# EasyEDA Pro project stm32rct6开发板.epro, board PCB1
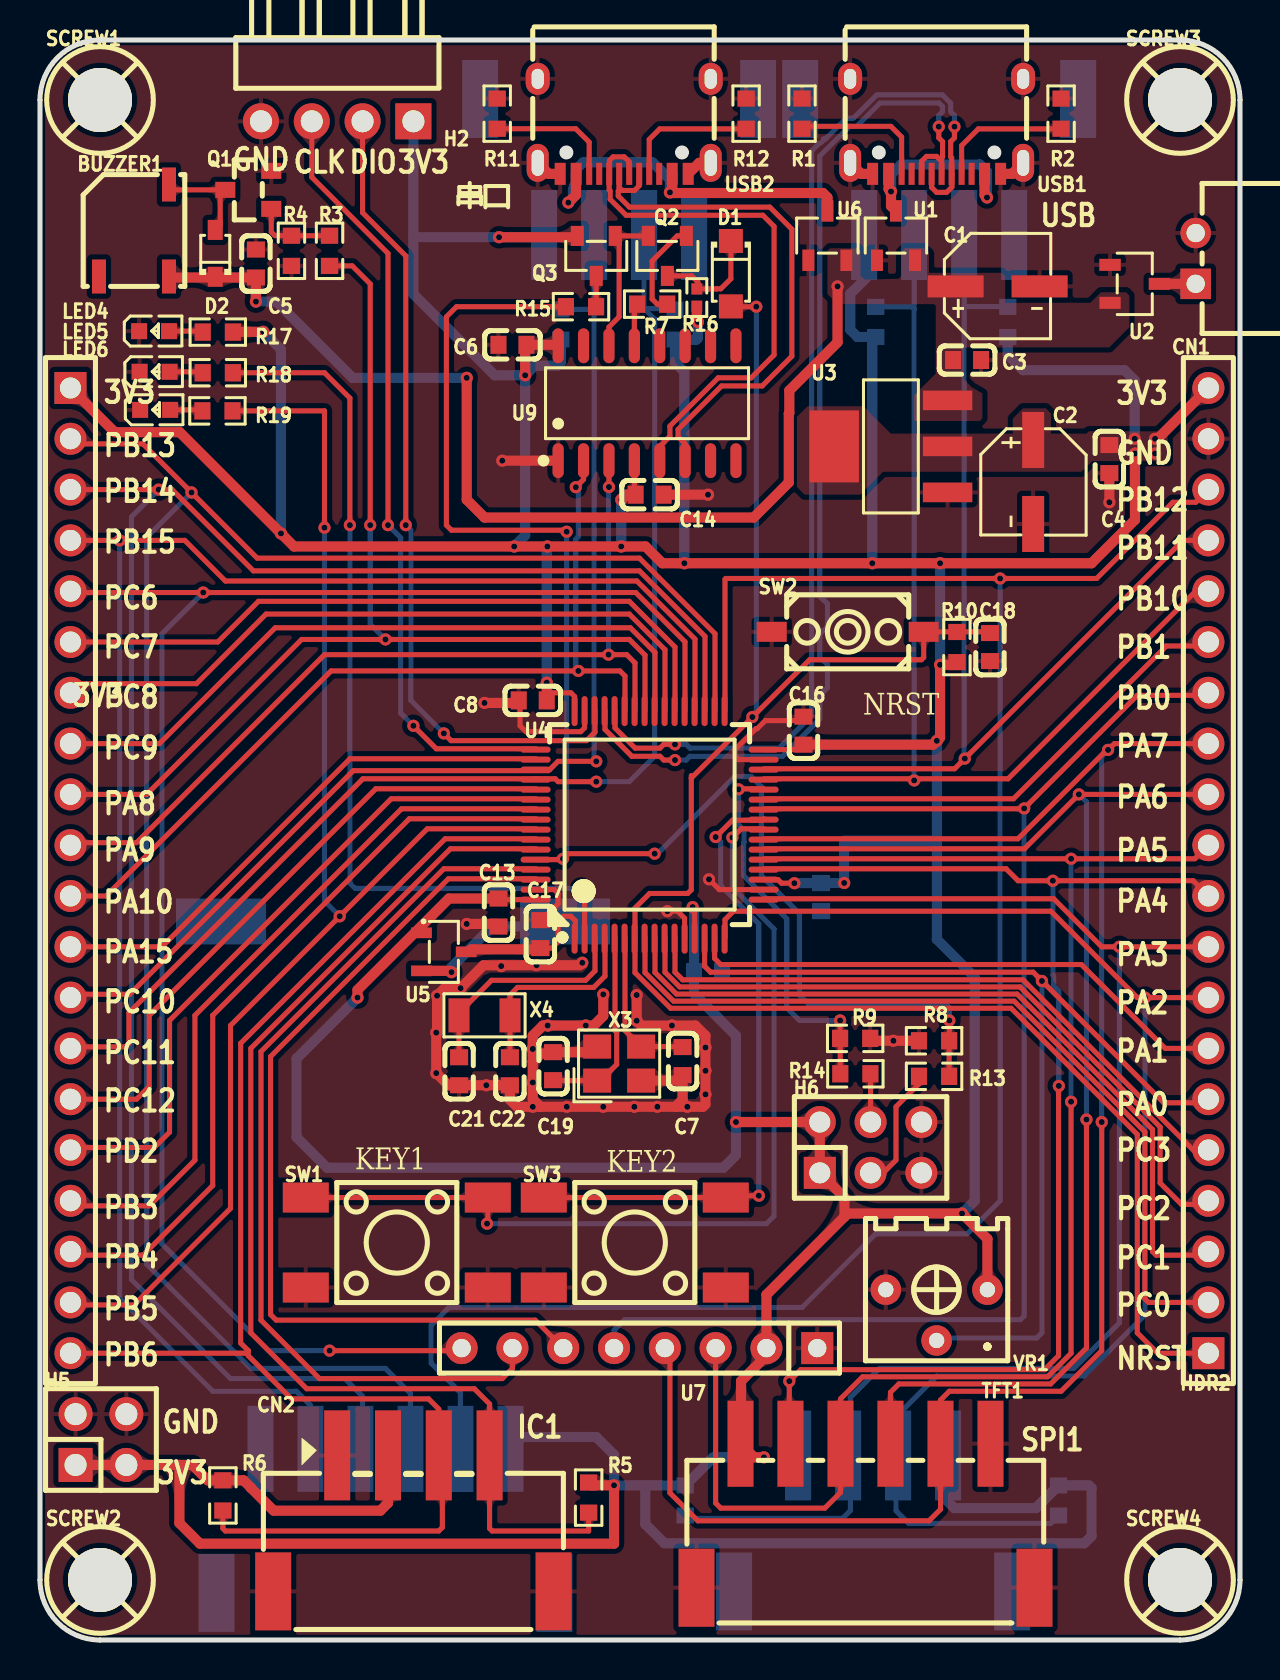
[diagram p3: board, top side]
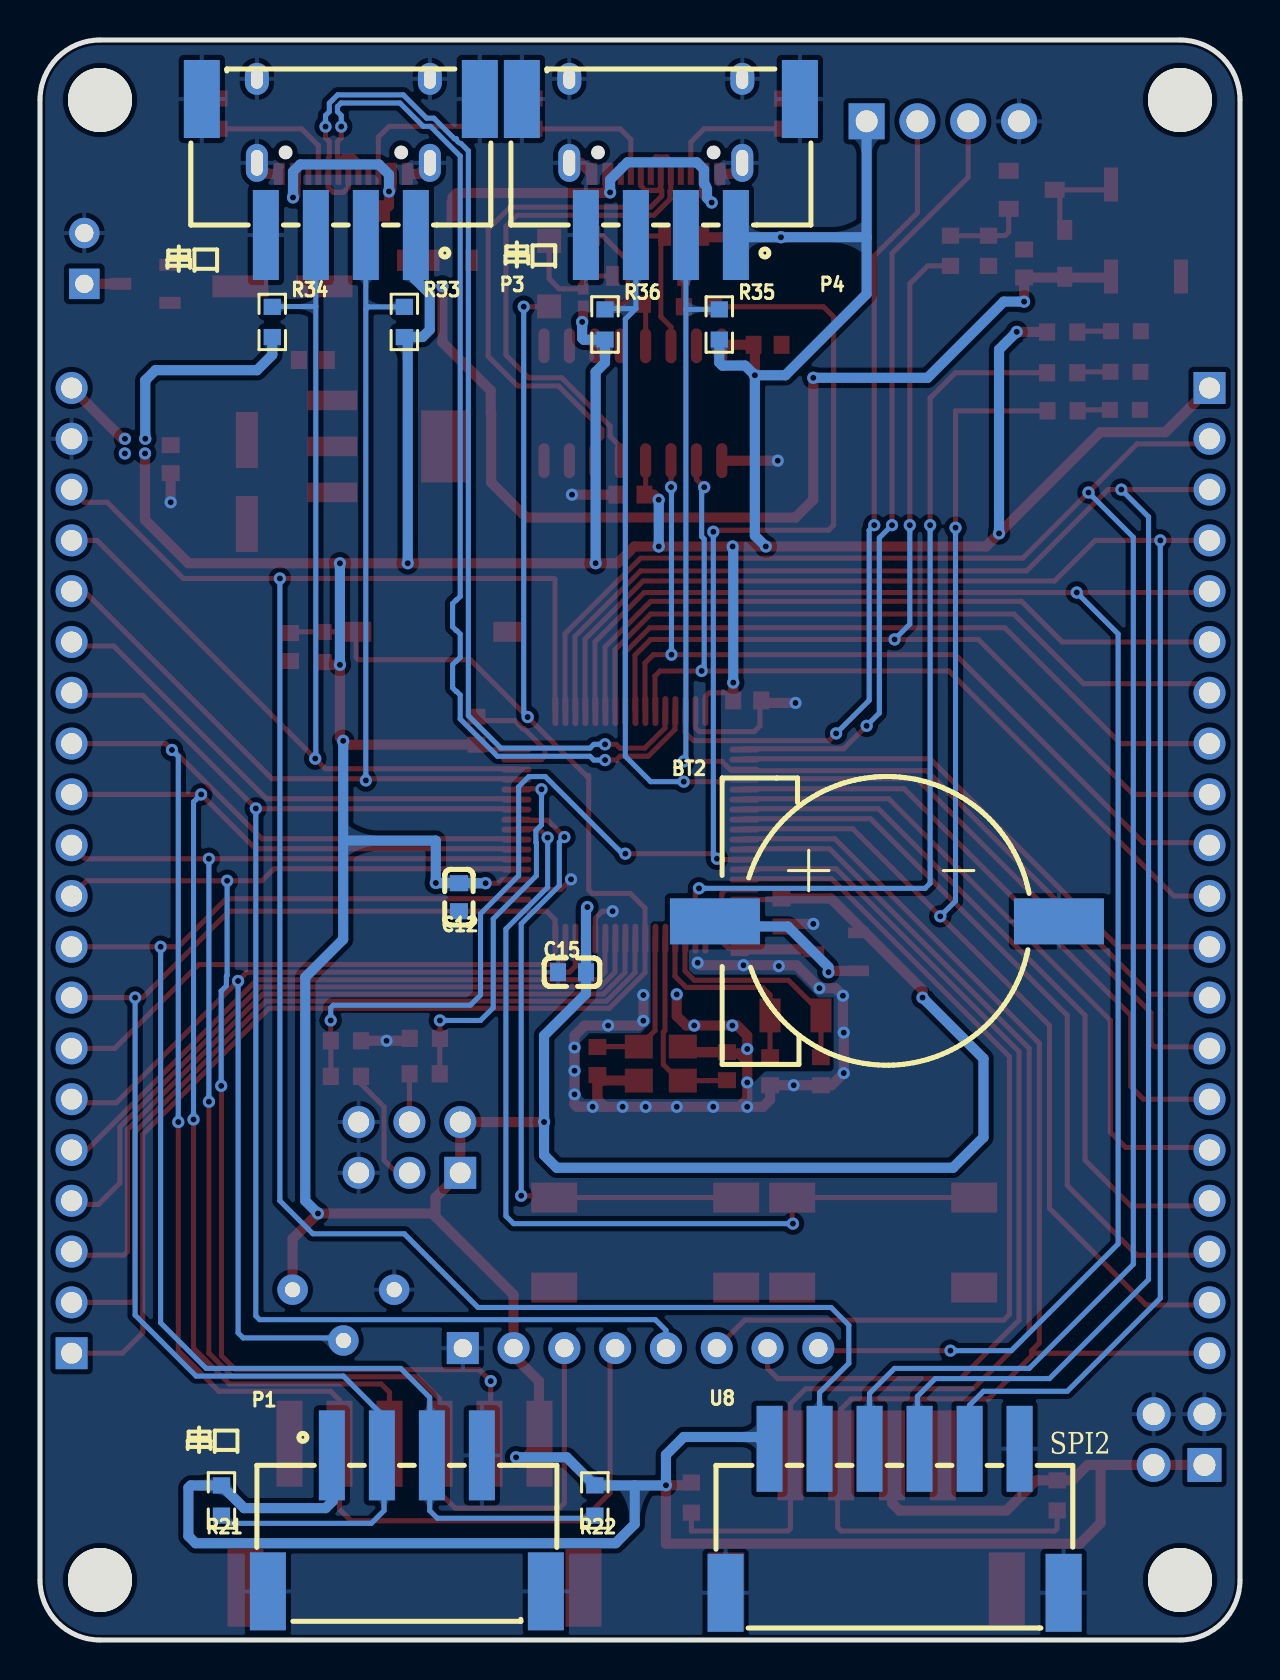
[diagram p4: board, bottom side, seen from below]

Outline 60 x 80 mm; copper layers: Top Layer, Bottom Layer. Coordinates in mm from the lower left corner of the outline.
Outline path: 0,77 0,3 arc(0.88,0.88) 3,0 57,0 arc(59.12,0.88) 60,3 60,77 arc(59.12,79.12) 57,80 3,80 arc(0.88,79.12) 0,77
Stack: Top Layer 0.035mm / Dielectric1 1.51mm FR4 er 4.5 / Bottom Layer 0.035mm

## Design rules (mm)
net +5V: POWER
net +3V3: POWER
net PA11: DP2
net PA12: DP2
net USB_D+: DP1
net USB_D-: DP1
spacing copperThickness1oz (default): track to track 0.102, other pairs 0.152 to 0.3
spacing copperThickness2oz: track to track 0.203, other pairs 0.152 to 0.3
track width copperThickness1oz (default): min 0.127, default 0.508, max 2.54
track width copperThickness2oz: min 0.203, default 0.508, max 2.54
differential pair differentialPair (default): width min 0.127, default 0.254, max 2.54; gap min 0.152, default 0.152
net +3V3 uses copperRegion_copperThickness2oz, copperThickness2oz
net class POWER uses copperThickness2oz
net +5V uses copperRegion_copperThickness2oz, copperThickness2oz
net GND uses copperRegion_copperThickness1oz

## Placement (name value [footprint] x y rotation side)
BT2  CR1220-2ZX  [BAT-SMD_CR1220-2ZX]  17.65 35.93 180 bottom
BUZZER1  4kHz  [BUZ-SMD_L5.0-W5.5-P4.60]  4.7 70.47 90 top
C1  10uF  [CAP-SMD_BD5.0-L5.3-W5.3-LS6.0-FD]  47.88 67.68 0 top
C2  10uF  [CAP-SMD_BD5.0-L5.3-W5.3-LS6.0-FD]  49.66 57.9 270 top
C3  100nF  [C0603]  46.35 64 180 top
C4  100nF  [C0603]  53.47 59.05 90 top
C5  100nF  [C0603]  10.79 68.82 90 top
C6  100nF  [C0603]  23.62 64.76 0 top
C7  18pF  [C0603]  32.13 28.95 90 top
C8  100nF  [C0603]  24.64 46.98 0 top
C12  100nF  [C0603]  39.05 37.14 90 bottom
C13  100nF  [C0603]  22.93 36.37 90 top
C14  100nF  [C0603]  30.48 57.27 180 top
C15  100nF  [C0603]  33.4 33.39 180 bottom
C16  100nF  [C0603]  38.18 45.47 270 top
C17  100nF  [C0603]  25.02 35.3 90 top
C18  100nF  [C0603]  47.5 49.65 90 top
C19  18pF  [C0603]  25.65 28.69 90 top
C21  18pF  [C0603]  20.96 28.44 270 top
C22  18pF  [C0603]  23.5 28.44 90 top
CN1  WAFER-XH254WZ-2AM  [CONN-TH_2P-P2.50_WAFER-XH254WZ-2A]  57.78 69.08 90 top
CN2  XDWF-2500-04P  [CONN-SMD_4P-P2.54_MXXH-2.54-04P-WT1-0-A]  18.67 5.83 0 top
D1  1N4007W  [SOD-123FL_L2.7-W1.8-LS3.8-RD]  34.54 68.32 270 top
D2  1N5819WS  [SOD-323_L1.8-W1.3-LS2.5-RD]  8.76 69.33 90 top
H2  PZ254R-11-04P  [HDR-TH_4P-P2.54-H-M-W10.4]  14.86 75.94 180 top
H5  PZ254V-12-4P  [HDR-TH_4P-P2.54-V-M-R2-C2-S2.54]  3.05 10.02 0 top
H6  -  [HDR-TH_6P-P2.54-V-R2-C3-S2.54_A2541WV-2X3P]  41.53 24.63 0 top
HDR1  PH2.54-01-20PZD  [HDR-TH_20P-P2.54-V-M-4]  1.52 38.47 270 top
HDR2  PH2.54-01-20PZD  [HDR-TH_20P-P2.54-V-M-4]  58.42 38.47 90 top
LED4  LTST-C190KSKT  [LED0603-RD]  5.7 65.44 0 top
LED5  LTST-C190KSKT  [LED0603-RD]  5.73 63.41 0 top
LED6  LTST-C190KSKT  [LED0603-RD]  5.76 61.51 0 top
P1  -  [CONN-SMD_XH2.54-4PSMD]  41.66 5.83 180 bottom
P3  -  [CONN-SMD_XH2.54-4PSMD]  44.96 73.65 0 bottom
P4  -  [CONN-SMD_XH2.54-4PSMD]  28.96 73.65 0 bottom
Q1  SS8050  [SOT-23_L2.9-W1.3-P1.90-LS2.4-BR]  10.41 72.51 0 top
Q2  S8050(0.5A)  [SOT-23-3_L2.9-W1.3-P1.90-LS2.4-BR]  31.37 69.2 90 top
Q3  S8550  [SOT-23-3_L2.9-W1.3-P1.90-LS2.4-BR]  27.81 69.2 90 top
R1  5.1kΩ  [R0603]  38.1 76.32 90 top
R2  5.1kΩ  [R0603]  51.05 76.32 90 top
R3  560Ω  [R0603]  14.48 69.46 90 top
R4  10kΩ  [R0603]  12.57 69.46 270 top
R5  4.7kΩ  [R0603]  27.43 7.12 270 top
R6  4.7kΩ  [R0603]  9.14 7.23 270 top
R7  1kΩ  [R0603]  30.61 66.79 0 top
R8  100kΩ  [R0603]  44.7 29.96 180 top
R9  10kΩ  [R0603]  40.76 30.08 180 top
R10  10kΩ  [R0603]  45.85 49.65 270 top
R11  5.1kΩ  [R0603]  22.86 76.32 90 top
R12  5.1kΩ  [R0603]  35.31 76.32 90 top
R13  10kΩ  [R0603]  44.7 28.18 180 top
R14  10kΩ  [R0603]  40.77 28.31 180 top
R15  1kΩ  [R0603]  27.05 66.67 0 top
R16  10kΩ  [R0402]  32.84 67.12 270 top
R17  1kΩ  [R0603]  8.89 65.39 180 top
R18  1kΩ  [R0603]  8.89 63.36 180 top
R19  1kΩ  [R0603]  8.87 61.46 180 top
R21  10K  [R0603]  50.93 6.97 90 bottom
R22  10K  [R0603]  32.26 6.97 90 bottom
R33  10K  [R0603]  41.78 65.9 270 bottom
R34  10K  [R0603]  48.39 65.9 270 bottom
R35  10K  [R0603]  26.03 65.78 270 bottom
R36  10K  [R0603]  31.75 65.78 270 bottom
SCREW1  -  [M3螺丝]  3 77 0 top
SCREW2  -  [M3螺丝]  3 3 0 top
SCREW3  -  [M3螺丝]  57 77 0 top
SCREW4  -  [M3螺丝]  57 3 0 top
SW1  -  [SW-SMD_4P-L6.0-W6.0-P4.50-LS9.0-2]  17.84 19.87 0 top
SW2  K2-1107ST-A4DW-06  [KEY-SMD_L6.2-W3.6-LS8.0_K2-1107ST-A4SW-06]  40.39 50.41 0 top
SW3  -  [SW-SMD_4P-L6.0-W6.0-P4.50-LS9.0-2]  29.74 19.87 0 top
TFT1  1.8 TFT 128*RGB*160  [LCD-TH_8P-P2.54-L56.0-W34.0_1.8-TFT]  29.97 14.59 180 top
U1  CH213K  [SOT-23-3_L2.9-W1.6-P1.90-LS2.8-BR]  42.8 70.22 270 top
U2  CH213K  [SOT-23-3_L2.9-W1.6-P1.90-LS2.8-BR]  54.74 67.81 180 top
U3  AMS1117-3.3  [SOT-223-4_L6.5-W3.5-P2.30-LS7.0-BR]  42.54 59.68 0 top
U4  STM32F103RCT6  [LQFP-64_L10.0-W10.0-P0.50-LS12.0-BL]  30.48 40.76 0 top
U5  BAT54C  [SOT-23-3_L2.9-W1.3-P1.90-LS2.8-BR]  20.19 34.41 180 top
U6  CH213K  [SOT-23-3_L2.9-W1.6-P1.90-LS2.8-BR]  39.37 70.22 270 top
U7  XH2.54mm-LI-6P  [CONN-SMD_6P-P2.50-H]  41.28 6.21 0 top
U8  XH2.54mm-LI-6P  [CONN-SMD_6P-P2.50-H]  17.27 5.96 180 bottom
U9  CH340C  [SOP-16_L10.0-W3.9-P1.27-LS6.0-BL]  30.35 61.84 0 top
USB1  TYPE-C 16PIN 2MD(073)  [USB-C-SMD_TYPE-C-16PIN-2MD-073]  44.83 75.68 180 top
USB2  TYPE-C 16PIN 2MD(073)  [USB-C-SMD_TYPE-C-16PIN-2MD-073]  29.21 75.68 180 top
VR1  10kΩ  [RES-ADJ-TH_3362P]  44.83 16.25 180 top
X3  8MHz  [CRYSTAL-SMD_4P-L3.2-W2.5-BL]  28.96 28.82 0 top
X4  32.768kHz  [CRYSTAL-SMD_L3.2-W1.5-1]  22.22 31.23 0 top

## Footprints (pads in the part's own frame, mm; a bottom-side part is the same pattern mirrored in y, then rotated)
BAT-SMD_CR1220-2ZX
  rect 4.5x2.3 smd: 1(-8.6,0) 2(8.6,0)
BUZ-SMD_L5.0-W5.5-P4.60
  rect 1.7x0.7 smd: 1(-2.3,-1.75) 2(2.3,-1.75) 3(-2.3,1.75)
C0603
  rect 0.8x0.9 smd: 1(-0.7,0) 2(0.7,0)
CAP-SMD_BD5.0-L5.3-W5.3-LS6.0-FD
  rect 2.8x1.1 smd: 1(-2.1,0) 2(2.1,0)
CONN-SMD_4P-P2.54_MXXH-2.54-04P-WT1-0-A
  rect 1.3x4.5 smd: 1(-3.809,3.4) 2(-1.27,3.4) 3(1.27,3.4) 4(3.81,3.4)
  rect 1.8x3.9 smd: 5(7.01,-3.4) 6(-7.01,-3.4)
CONN-SMD_6P-P2.50-H
  rect 1.3x4.3 smd: 1(-6.25,3.6) 2(-3.751,3.6) 3(-1.25,3.6) 4(1.25,3.6) 5(3.75,3.6) 6(6.25,3.6)
  rect 1.8x3.9 smd: 7(-8.45,-3.6) 8(8.45,-3.6)
CONN-SMD_XH2.54-4PSMD
  rect 1.3x4.5 smd: 1(-3.75,3.4) 2(-1.25,3.4) 3(1.25,3.4) 4(3.75,3.4)
  rect 1.8x3.9 smd: 5(-6.95,-3.4) 6(6.95,-3.4)
CONN-TH_2P-P2.50_WAFER-XH254WZ-2A
  rect 1.524x1.524 hole 0.914: 1(-1.27,0)
  round 1.524 hole 0.914: 2(1.27,0)
CRYSTAL-SMD_4P-L3.2-W2.5-BL
  rect 1.4x1.2 smd: 1(-1.1,-0.85) 2(1.1,-0.85) 3(1.1,0.85) 4(-1.1,0.85)
CRYSTAL-SMD_L3.2-W1.5-1
  rect 1.05x1.7 smd: 1(-1.275,0) 2(1.275,0)
HDR-TH_4P-P2.54-H-M-W10.4
  rect 1.8x1.8 hole 1.1: 1(-3.81,0)
  round 1.8 hole 1.1: 2(-1.27,0) 3(1.27,0) 4(3.81,0)
HDR-TH_4P-P2.54-V-M-R2-C2-S2.54
  rect 1.7x1.7 hole 1.1: 1(-1.27,-1.27)
  round 1.7 hole 1.1: 2(-1.27,1.27) 3(1.27,-1.27) 4(1.27,1.27)
HDR-TH_6P-P2.54-V-R2-C3-S2.54_A2541WV-2X3P
  rect 1.6x1.6 hole 1.05: 1(-2.54,-1.27)
  round 1.6 hole 1.05: 2(-2.54,1.27) 3(0,-1.27) 4(0,1.27) 5(2.54,-1.27) 6(2.54,1.27)
HDR-TH_20P-P2.54-V-M-4
  rect 1.6x1.6 hole 1.05: 1(-24.13,0)
  round 1.6 hole 1.05: 2(-21.59,0) 3(-19.05,0) 4(-16.51,0) 5(-13.97,0) 6(-11.43,0) 7(-8.89,0) 8(-6.35,0) 9(-3.81,0) 10(-1.27,0) 11(1.27,0) 12(3.81,0) 13(6.35,0) 14(8.89,0) 15(11.43,0) 16(13.97,0) 17(16.51,0) 18(19.05,0) 19(21.59,0) 20(24.13,0)
KEY-SMD_L6.2-W3.6-LS8.0_K2-1107ST-A4SW-06
  rect 1.5x1 smd: 1(-3.8,0) 2(3.8,0)
LCD-TH_8P-P2.54-L56.0-W34.0_1.8-TFT
  rect 1.6x1.6 hole 0.914: 1(-8.89,0)
  round 1.6 hole 0.914: 2(-6.35,0) 3(-3.81,0) 4(-1.27,0) 5(1.27,0) 6(3.81,0) 7(6.35,0) 8(8.89,0)
LED0603-RD
  rect 0.8x0.8 smd: 1(-0.749,0) 2(0.749,0)
LQFP-64_L10.0-W10.0-P0.50-LS12.0-BL
  oval 0.3x1.5 smd: 1(-3.75,-5.688) 2(-3.25,-5.688) 3(-2.75,-5.688) 4(-2.25,-5.688) 5(-1.75,-5.688) 6(-1.25,-5.688) 7(-0.75,-5.688) 8(-0.25,-5.688) 9(0.25,-5.688) 10(0.75,-5.688) 11(1.25,-5.688) 12(1.75,-5.688) 13(2.25,-5.688) 14(2.75,-5.688) 15(3.25,-5.688) 16(3.75,-5.688) 33(3.75,5.688) 34(3.25,5.688) 35(2.75,5.688) 36(2.25,5.688) 37(1.75,5.688) 38(1.25,5.688) 39(0.75,5.688) 40(0.25,5.688) 41(-0.25,5.688) 42(-0.75,5.688) 43(-1.25,5.688) 44(-1.75,5.688) 45(-2.25,5.688) 46(-2.75,5.688) 47(-3.25,5.688) 48(-3.75,5.688)
  oval 1.5x0.3 smd: 17(5.7,-3.738) 18(5.7,-3.238) 19(5.7,-2.738) 20(5.7,-2.238) 21(5.7,-1.738) 22(5.7,-1.238) 23(5.7,-0.739) 24(5.7,-0.238) 25(5.7,0.262) 26(5.7,0.762) 27(5.7,1.262) 28(5.7,1.762) 29(5.7,2.261) 30(5.7,2.762) 31(5.7,3.261) 32(5.7,3.762) 49(-5.7,3.762) 50(-5.7,3.261) 51(-5.7,2.762) 52(-5.7,2.261) 53(-5.7,1.762) 54(-5.7,1.262) 55(-5.7,0.762) 56(-5.7,0.262) 57(-5.7,-0.238) 58(-5.7,-0.739) 59(-5.7,-1.238) 60(-5.7,-1.738) 61(-5.7,-2.238) 62(-5.7,-2.738) 63(-5.7,-3.238) 64(-5.7,-3.738)
M3螺丝
  round 3.2 hole 3.2: 1(0,0)
R0402
  rect 0.566x0.54 smd: 1(-0.433,0) 2(0.433,0)
R0603
  rect 0.806x0.864 smd: 1(-0.753,0) 2(0.753,0)
RES-ADJ-TH_3362P
  round 1.524 hole 0.762: 1(-2.54,-1.27) 2(0,1.27) 3(2.54,-1.27)
SOD-123FL_L2.7-W1.8-LS3.8-RD
  rect 1.2x1.2 smd: 1(-1.635,0) 2(1.635,0)
SOD-323_L1.8-W1.3-LS2.5-RD
  rect 1x0.75 smd: 1(-1.173,0) 2(1.173,0)
SOP-16_L10.0-W3.9-P1.27-LS6.0-BL
  oval 0.56x1.745 smd: 1(-4.445,-2.873) 2(-3.175,-2.873) 3(-1.905,-2.873) 4(-0.635,-2.873) 5(0.635,-2.873) 6(1.905,-2.873) 7(3.175,-2.873) 8(4.445,-2.873) 9(4.445,2.873) 10(3.175,2.873) 11(1.905,2.873) 12(0.635,2.873) 13(-0.635,2.873) 14(-1.905,2.873) 15(-3.175,2.873) 16(-4.445,2.873)
SOT-23-3_L2.9-W1.3-P1.90-LS2.4-BR
  rect 1x0.65 smd: 1(1,-0.95) 2(1,0.95) 3(-1,0)
SOT-23-3_L2.9-W1.3-P1.90-LS2.8-BR
  rect 1.04x0.532 smd: 1(1.12,-0.95) 2(1.12,0.95) 3(-1.12,0)
SOT-23-3_L2.9-W1.6-P1.90-LS2.8-BR
  rect 1.07x0.6 smd: 1(1.235,-0.95) 2(1.235,0.95) 3(-1.235,0)
SOT-23_L2.9-W1.3-P1.90-LS2.4-BR
  rect 1x0.8 smd: 1(1.15,-0.95) 2(1.15,0.95) 3(-1.15,0)
SOT-223-4_L6.5-W3.5-P2.30-LS7.0-BR
  rect 2.47x0.98 smd: 1(2.835,-2.3) 2(2.835,0) 3(2.835,2.3)
  rect 2.47x3.6 smd: 4(-2.835,0)
SW-SMD_4P-L6.0-W6.0-P4.50-LS9.0-2
  rect 2.3x1.5 smd: 1(-4.55,2.25) 2(4.55,2.25) 3(-4.55,-2.25) 4(4.55,-2.25)
USB-C-SMD_TYPE-C-16PIN-2MD-073
  oval 1.1x1.9 hole 0.6x1.3: 13(-4.325,1.825) 14(4.325,1.825)
  oval 1.2x1.6 hole 0.6x1: 13(-4.325,-2.375) 14(4.325,-2.375)
  rect 0.55x1.1 smd: A1B12(-3.2,2.375) A4B9(-2.4,2.375) B1A12(3.2,2.375) B4A9(2.4,2.375)
  rect 0.3x1.1 smd: A5(-1.25,2.375) A6(-0.25,2.375) A7(0.25,2.375) A8(1.25,2.375) B5(1.75,2.375) B6(0.75,2.375) B7(-0.75,2.375) B8(-1.75,2.375)

## Nets
As in the schematic.

Pads without a net: BUZZER1 3; SCREW1 1; SCREW2 1; SCREW3 1; SCREW4 1; U9 7 8 9 10 11 12 15; USB1 A8 B8; USB2 A8 B8

## Via types
v1: diameter 0.61, hole 0.305, Top Layer to Bottom Layer, 121 vias

## Routing (per net, layer and track width the routed paths; a pad name or vN(x,y) marks a point on that pad's centre or on a via; arc(x,y) is an arc through that point)
+3V3: length 423.3
  Top Layer w0.254: C13.2 22.98,37.02 U4.64 ; C16.2 37.93,44.52 U4.32 ; v1(37.72,37.84) 37.08,37.84 36.9,38.02 U4.19 ; 25.34,47.11 25.59,47.36 26.54,47.36 26.73,47.17 26.73,46.44 ; v1(32.63,36.65) 32.73,36.55 U4.13 ; U9.4 29.72,57.27
  Top Layer w0.508: v1(15.88,32.12) 15.88,32.5 20.45,37.07 C13.2 ; C8.2 v1(25.34,47.87) ; R17.1 9.66,65.41 v1(11.16,65.41) ; 47.37,17.52 47.37,20.06 v1(46.1,21.33) 40.39,21.33 40.22,21.16 ; C16.2 44.65,44.77 45,45.12 v1(45,48.76) 45.71,48.76 R10.2 ; 6.97,8.75 7.62,8.75 8.39,7.98 R6.1 10.18,7.98 10.54,7.62 10.54,7.61 11.68,6.47 17.02,6.47 17.4,6.85 CN2.2 ; 6.97,8.75 H5.3 H5.1 ; 6.97,8.75 6.97,5.85 8,4.82 28.7,4.82 v1(28.7,7.74) 27.57,7.74 R5.1 ; v1(29.07,57.01) 29.32,57.27 C14.2 ; v1(34.8,25.9) H6.2 H6.1 40.22,22.12 40.22,21.16 ; v1(22.95,70.14) 26.8,70.14 Q3.2 ; v1(32.89,65.9) 32.84,65.95 R16.2 ; HDR1.1 3.73,60.39 6.98,60.39 v1(12.05,55.33) 12.7,54.68 v1(23.71,54.68) v1(25.37,54.68) v1(29.06,54.68) 30.28,54.68 31.12,53.84 v1(32.22,53.84) v1(41.61,53.84) v1(45,53.84) 52.58,53.84 54.75,56.01 v1(54.75,59.33) ; v1(55.75,60.06) 55.88,60.06 HDR2.20 ; 40.22,21.16 36.32,17.26 TFT1.2 36.32,14.21 35.05,12.94 35.05,9.84 U7.1 35.7,9.13 v1(36.19,9.13) ; v1(24.26,63.24) 24.26,64.69 C6.2 25.86,64.76 U9.16
  Bottom Layer w0.508: P3.1 41.28,70.18 41.28,68.07 40.51,67.31 40.51,65.51 40.87,65.15 R33.2 41.61,64.98 v1(41.61,53.84) ; v1(54.74,60.06) 54.74,62.98 54.23,63.49 49.15,63.49 48.39,64.25 R34.2 ; 30.26,7.73 R22.2 33.66,9.13 v1(36.19,9.13) ; 30.26,7.73 28.71,7.73 v1(28.7,7.74) 28.7,9.26 27.81,10.15 24.11,10.15 U8.1 ; 30.26,7.73 30.26,5.79 31.22,4.84 52.22,4.84 52.58,5.2 52.58,7.61 52.46,7.73 R21.2 49.79,6.59 45.72,6.59 45.36,6.95 45.36,9.19 P1.1 ; v1(12.05,55.33) 12.05,64.52 v1(11.16,65.41) ; 31.75,64.76 31.75,63.87 32.22,63.4 v1(32.22,53.84) ; 31.75,64.76 32,65.01 32.81,65.01 32.89,65.09 v1(32.89,65.9) ; 31.75,64.76 R36.2 ; v1(44.84,44.96) 44.84,39.97 ; 44.84,39.97 44.84,35.03 46.74,33.14 46.74,21.96 v1(46.1,21.33) ; 44.84,39.97 40.21,39.97 v1(40.21,37.85) 39.07,37.85 C12.2 v1(37.72,37.84) ; v1(24.26,63.24) 24.74,63.72 25.89,63.72 26.03,63.87 R35.2 ; v1(24.26,63.24) 22.73,63.24 18.67,67.3 18.67,70.14 ; v1(24.26,63.24) 24.26,55.22 v1(23.71,54.68) ; v1(29.06,54.68) 29.06,57.01 v1(29.07,57.01) ; P4.1 25.1,70.14 v1(22.95,70.14) 18.67,70.14 ; v1(32.63,36.65) 32.7,36.58 32.7,32.31 34.8,30.22 v1(34.8,25.9) 34.8,24.25 34.16,23.61 14.35,23.61 12.83,25.14 12.83,29.07 v1(15.88,32.12) ; v1(25.34,47.87) 25.34,54.54 25.4,54.6 ; v1(45,53.84) v1(45,48.76) ; 18.67,70.14 H2.1
  vias: v1(55.76,59.33)
+5V: length 51.8
  Top Layer w0.508: v1(39.88,67.68) 39.88,64.89 37.47,62.47 37.47,61.35 37.44,61.32 37.44,57.88 35.69,56.12 22.22,56.12 21.34,57.01 v1(21.34,63.11) ; BUZZER1.1 6.5,68.12 C5.1 v1(10.79,66.92)
  Bottom Layer w0.508: v1(10.79,66.92) 11.81,66.92 15.62,63.11 v1(21.34,63.11)
GND: length 88.3
  Top Layer w0.254: U4.31 34.93,44.02 34.75,44.2 34.75,44.51 35.79,45.56 35.86,45.56 36.26,45.97 37.98,45.97 C16.1 ; v1(31.37,36.44) 31.88,36.44 32.23,36.09 U4.12 ; 27.23,46.44 27.23,45.61 27.04,45.42 24.3,45.42 24,45.71 24,46.92 C8.1 ; C17.2 25.08,36 25.91,36.82 25.91,37.33 25.72,37.52 U4.63 ; U4.18 33.97,37.52 v1(33.45,38.03)
  Top Layer w0.508: USB2.A1B12 32.96,73.86 USB2.13 ; C4.1 v1(53.47,56.89) ; C14.1 v1(33.4,57.27) ; USB1.B1A12 41.06,73.31 USB1.14 ; U9.1 v1(23.11,58.97) ; 24.64,28.92 v1(24.64,27.88) 24.64,27.05 25.03,26.66 ; 24.64,28.92 v1(24.64,29.55) 24.64,30.22 25.15,30.72 v1(27.29,30.72) 27.69,30.72 28.16,31.2 v1(28.16,32.28) ; 24.64,28.92 25.05,29.33 25.59,29.33 C19.2 27.58,29.39 X3.4 ; 30.06,27.97 31.85,27.97 C7.1 32.13,27.02 31.77,26.66 ; C8.1 23.81,46.85 v1(22.22,46.85) ; R9.1 41.63,29.96 v1(42.67,29.96) R8.2 ; 31.77,26.66 v1(30.87,26.66) v1(29.72,26.66) v1(28.16,26.66) v1(26.34,26.66) 25.03,26.66 ; 31.77,26.66 v1(32.37,26.66) 33.15,26.66 33.27,26.79 v1(33.27,27.28) v1(33.27,28.46) v1(33.27,29.62) 33.27,30.22 32.77,30.72 v1(31.59,30.72) 30.07,30.72 v1(29.83,30.96) v1(29.83,32.25) ; USB1.13 48.61,73.31 48.03,73.31 ; C13.1 22.79,35.8 v1(21.34,35.8) ; 25.03,26.66 v1(24.64,26.66) 23.85,26.66 23.5,27.02 C22.1 v1(22.32,27.74) C21.2 20.42,27.74 v1(19.81,28.34) v1(19.81,30.37) 19.85,30.41 v1(19.85,32.21) 20.23,32.59 v1(21.03,32.59) 22.17,33.73 23.02,33.73 v1(23.06,33.69) 23.1,33.74 v1(24.83,33.74) 26.99,33.74 v1(27.12,33.86) ; 24.88,73.86 25.44,73.31 USB2.B1A12
  vias: v1(25.38,30.72)
VBAT: length 7.6
  Top Layer w0.254: U4.1 26.77,35.11 26.77,35.96 26.54,36.19 26.16,36.19 25.91,35.93 25.91,34.92 25.59,34.6 C17.1
  Top Layer w0.508: 24.96,34.53 21.57,34.53 21.44,34.41
VBUS1: length 10.5
  Top Layer w0.508: 42.43,73.31 42.43,72.55 v1(42.55,72.43) 42.55,71.7 U1.3 ; v1(47.35,72.13) 47.23,72.24 USB1.A4B9
  Bottom Layer w0.508: v1(42.55,72.43) 42.55,73.27 43.05,73.78 46.99,73.78 47.35,73.42 v1(47.35,72.13)
VBUS2: length 18.9
  Top Layer w0.508: USB2.B4A9 26.8,73.29 26.8,72.25 v1(26.42,71.87) ; U6.3 39.41,71.46 39.37,71.49 39.37,72.13 39.15,72.35 31.53,72.35 v1(31.5,72.38) 31.61,72.49 USB2.A4B9
  Bottom Layer w0.508: v1(26.42,71.87) 26.65,72.11 26.65,72.5 arc(26.69,72.67) 26.8,72.81 26.8,73.52 27.16,73.88 30.63,73.88 31.5,73.02 v1(31.5,72.38)
VBUS3: length 1.8
  Top Layer w0.508: CN1.1 U2.3
ADC_EXT0: length 41.6
  Top Layer w0.254: HDR2.2 55.42,16.88 55.25,17.06 55.25,25.4 48.71,31.94 31.68,31.94 30.25,33.37 30.25,35.11
ADC_EXT1: length 38.9
  Top Layer w0.254: HDR2.3 58.24,19.24 55.81,19.24 55.63,19.42 55.63,25.53 48.85,32.3 31.83,32.3 30.75,33.38 30.75,35.11
ADC_EXT2: length 35.4
  Top Layer w0.254: 31.25,35.11 31.25,33.39 31.98,32.65 49,32.65 56.01,25.65 56.01,22.85 57.08,21.78 58.24,21.78 HDR2.4
ADC_EXT3: length 32.1
  Top Layer w0.254: HDR2.5 58.37,24.45 57.71,24.45 49.15,33.01 32.13,33.01 31.75,33.39 31.75,35.11
ADC_EXT4: length 27.5
  Top Layer w0.254: U4.15 33.73,34.08 34.04,33.77 52.07,33.77 56.26,29.58 HDR2.7
ADC_POT: length 52.6
  Top Layer w0.254: U4.14 33.23,33.69 33.53,33.39 49.66,33.39 v1(50.1,32.95) 56.19,26.86 58.24,26.86 HDR2.6
  Bottom Layer w0.254: 44.83,14.59 45.34,15.1 49.84,15.1 50.1,15.36 v1(50.1,32.95)
AUX_PA15: length 27.2
  Top Layer w0.254: 24.8,44.06 15.5,44.06 6.1,34.66 HDR1.12
AUX_PB0: length 71.7
  Top Layer w0.254: 36.2,41.56 49.19,41.56 v1(49.21,41.58) 54.86,47.23 58.29,47.23 HDR2.14
  Bottom Layer w0.254: TFT1.5 28.7,15.48 29.24,16.02 49.02,16.02 49.21,16.2 v1(49.21,41.58)
AUX_PB1: length 25.5
  Top Layer w0.254: 36.2,42.06 48.68,42.06 56.31,49.7 58.22,49.7 58.42,49.9
AUX_PB3: length 35.8
  Top Layer w0.254: HDR1.17 1.78,21.71 5.46,21.71 7.75,23.99 7.75,31.23 18.08,41.56 24.8,41.56
AUX_PB4: length 37.4
  Top Layer w0.254: 24.8,41.06 18.47,41.06 8.64,31.23 8.64,22.72 5.15,19.24 1.7,19.24 HDR1.18
BOOT0: length 74.8
  Top Layer w0.254: R15.1 20.83,66.67 20.32,66.16 20.32,55.74 20.57,55.49 26.26,55.49 v1(26.33,55.41) ; U4.60 26.11,39.02 v1(26.15,39.06) 26.4,39.32 v1(30.73,39.32) ; v1(45.47,30.98) 45.47,29.97 R8.1 R13.1
  Bottom Layer w0.254: v1(26.33,55.41) 26.33,39.25 v1(26.15,39.06) ; v1(30.73,39.32) 30.88,39.32 34.73,43.17 35.56,43.17 36.07,42.66 36.07,38.22 37.97,36.31 37.97,32.25 38.48,31.74 45.34,31.74 45.47,31.61 v1(45.47,30.98)
BOOT1: length 18.8
  Top Layer w0.254: v1(40,30.98) R9.2 40.01,30.07 R14.2 ; v1(34.93,42.53) 34.95,42.56 36.2,42.56
  Bottom Layer w0.254: v1(34.93,42.53) 34.93,40.76 35.2,40.48 35.2,39.88 35.18,39.86 35.18,38.22 37.34,36.06 37.34,31.61 37.97,30.98 v1(40,30.98)
BUZZ_PWM: length 55.5
  Top Layer w0.254: 30.25,46.49 30.25,49.24 29.46,50.03 v1(17.27,50.03) 13.08,50.03 5.33,42.28 HDR1.9 ; R3.1 15.61,68.71 16.51,67.81 v1(16.51,55.74)
  Bottom Layer w0.254: v1(17.27,50.03) 16.51,50.79 v1(16.51,55.74)
DTR: length 2.1
  Top Layer w0.254: U9.13 29.72,66.66 R7.1
GPIO_PB8: length 46
  Top Layer w0.254: 24.8,38.56 20.19,38.56 11.05,29.42 11.05,15.99 13.97,13.07 23.11,13.07 23.62,13.58 TFT1.7
GPIO_PB9: length 45.2
  Top Layer w0.254: TFT1.6 24.76,15.99 11.81,15.99 11.53,16.27 11.53,29.17 20.42,38.06 24.8,38.06
I2C1_SCL: length 72.3
  Top Layer w0.254: R6.2 9.14,5.58 9.27,5.45 19.94,5.45 20.12,5.63 20.12,9.05 CN2.3 19.94,11.55 19.43,12.06 12.57,12.06 10.41,14.21 10.41,14.47 ; 10.41,14.47 10.29,14.34 HDR1.20 ; 10.41,14.47 10.03,14.85 10.03,29.83 20.26,40.06 24.8,40.06
I2C1_SDA: length 58.2
  Top Layer w0.254: R5.2 27.43,5.45 22.61,5.45 22.48,5.58 CN2.4 22.48,11.8 21.72,12.56 13.34,12.56 10.54,15.36 10.54,29.58 20.52,39.56 24.8,39.56
KEY1: length 46.5
  Top Layer w0.254: 36.2,40.56 35.06,40.56 v1(34.62,40.12) ; 13.29,22.12 22.39,22.12 22.39,20.86 v1(22.35,20.82)
  Bottom Layer w0.254: v1(34.62,40.12) 34.62,37.63 36.7,35.55 36.7,21.2 36.32,20.82 v1(22.35,20.82)
KEY2: length 32.4
  Top Layer w0.254: 25.19,22.12 34.29,22.12 34.38,22.22 v1(35.94,22.22) ; 36.2,41.06 36.13,40.99 34.63,40.99 v1(33.78,40.15)
  Bottom Layer w0.254: v1(33.78,40.15) 34.03,39.89 34.03,37.72 35.94,35.81 v1(35.94,22.22)
LED2: length 68.7
  Top Layer w0.254: 24.8,40.56 19.36,40.56 v1(14.99,36.19) 9.53,30.72 9.53,21.58 4.7,16.75 1.65,16.75 HDR1.19 ; R19.1 14.22,61.46 v1(14.22,55.62)
  Bottom Layer w0.254: v1(14.22,55.62) 14.22,36.95 v1(14.99,36.19)
NRST: length 95.1
  Top Layer w0.254: C18.2 47.44,50.41 SW2.2 44.19,49.13 44.07,49.01 38.48,49.01 v1(35.62,46.15) 32.56,43.1 ; 32.56,43.22 32.56,43.1 ; 32.56,43.1 32.56,37.51 32.38,37.33 30.48,37.33 29.75,36.6 29.75,33.37 31.53,31.59 48.56,31.59 54.86,25.28 54.86,15.36 55.88,14.34 HDR2.1 ; v1(35.81,66.67) 34.56,66.67 D1.2
  Bottom Layer w0.254: v1(35.81,66.67) 35.81,46.34 v1(35.62,46.15)
OSC32_IN: length 11.5
  Top Layer w0.254: 20.83,29.27 20.95,29.39 20.95,31.36 22.58,32.98 27.28,32.98 27.75,33.45 27.75,35.11
OSC32_OUT: length 10
  Top Layer w0.254: 23.5,29.27 23.5,29.27 23.5,32.25 23.88,32.63 27.69,32.63 28.25,33.19 28.25,35.11
OSC_IN: length 9.9
  Top Layer w0.254: C19.1 25.68,27.97 28.03,27.97 28.84,28.78 28.84,30.38 28.75,30.47 28.75,35.11
OSC_OUT: length 7.9
  Top Layer w0.254: C7.2 32.11,29.67 X3.3 29.25,30.47 29.25,35.11
PA2: length 70.7
  Top Layer w0.254: 34.25,35.11 34.25,36.02 34.67,36.44 50.55,36.44 54.86,32.12 v1(55.25,32.12) 58.42,32.12
  Bottom Layer w0.254: v1(55.25,32.12) 55.25,16.25 52.2,13.2 44.83,13.2 43,11.37 43,9.33 P1.2 42.8,9.12 42.8,6.47 43.43,5.83 50.54,5.83 R21.1
PA3: length 71.2
  Top Layer w0.254: HDR2.9 v1(53.97,34.66) 53.09,34.66 50.69,37.06 36.2,37.06
  Bottom Layer w0.254: R22.1 32.39,6.09 40.13,6.09 40.51,6.47 40.51,9.12 P1.3 40.51,9.34 40.51,12.13 41.96,13.58 51.69,13.58 53.97,15.86 v1(53.97,34.66)
PA4: length 63.8
  Top Layer w0.254: 58.42,37.2 57.66,37.96 v1(50.64,37.96) 48.9,37.96 48.3,38.56 36.2,38.56 ; v1(50.94,27.71) 50.93,27.69 50.93,14.21 50.23,13.52 38.04,13.52 v1(37.47,12.94) 37.47,9.87 U7.2
  Bottom Layer w0.254: v1(50.64,37.96) 50.64,33.23 50.68,33.19 50.68,32.71 50.94,32.45 v1(50.94,27.71)
PA5: length 78.8
  Top Layer w0.254: TFT1.3 33.78,6.85 34.04,6.59 39.24,6.59 40.03,7.38 U7.3 40.03,12.06 41.13,13.16 50.38,13.16 51.56,14.34 v1(51.56,26.91) ; 36.2,39.06 v1(51.56,39.06) 57.74,39.06 HDR2.11
  Bottom Layer w0.254: v1(51.56,39.06) v1(51.56,26.91)
PA6: length 64.5
  Top Layer w0.254: 36.2,39.56 49.22,39.56 v1(51.94,42.28) HDR2.12 ; v1(52.32,26.03) 52.32,14.59 50.53,12.8 42.95,12.8 42.52,12.38 U7.4
  Bottom Layer w0.254: v1(52.32,26.03) 52.32,41.9 v1(51.94,42.28)
PA7: length 90.6
  Top Layer w0.254: 36.2,40.06 48.9,40.06 53.34,44.5 v1(53.4,44.5) 53.72,44.82 HDR2.13 ; TFT1.4 31.5,14.34 31.5,7.36 32.89,5.96 44.45,5.96 45.03,6.53 U7.5 45.03,12 45.47,12.44 51.05,12.44 53.09,14.47 v1(53.09,25.9)
  Bottom Layer w0.254: v1(53.4,44.5) 53.09,44.19 v1(53.09,25.9)
PA9: length 44.4
  Top Layer w0.254: HDR1.10 1.65,39.87 4.83,39.87 14.22,49.27 v1(28.43,49.27) 29.34,49.27 29.75,48.85 29.75,46.49 ; v1(28.45,57.65) U9.3
  Bottom Layer w0.254: v1(28.45,57.65) 28.43,57.63 v1(28.43,49.27)
PA10: length 45
  Top Layer w0.254: 1.52,37.2 3.3,37.2 14.55,48.45 v1(26.92,48.45) 29,48.45 29.25,48.2 29.25,46.49 ; U9.2 27.18,58.03 v1(26.79,57.64)
  Bottom Layer w0.254: v1(26.92,48.45) 26.79,48.58 26.79,55.04 26.92,55.17 26.92,57.51 v1(26.79,57.64)
PA11: length 54.8
  Top Layer w0.254: 28.75,46.49 28.75,45.6 29.76,44.59 31,44.59 31.19,44.78 v1(31.75,44.78) ; USB1.A7 44.58,72.63 44.83,72.38 45.33,72.38 45.59,72.64 45.59,73.3 USB1.B7 45.58,74.11 45.53,74.16 45.53,74.92 45.72,75.11 v1(45.72,75.67)
  Bottom Layer w0.254: v1(45.72,75.67) 45.72,76.23 45.53,76.42 45.53,76.84 45.12,77.26 41.83,77.26 40.67,76.09 40.31,76.09 39.27,75.06 39.18,75.06 arc(39.11,74.9) 38.95,74.82 38.58,74.46 38.58,46.22 36.96,44.59 32.5,44.59 32.31,44.78 v1(31.75,44.78)
PA12: length 54.7
  Top Layer w0.254: v1(44.94,75.67) 44.94,75.11 45.13,74.92 45.13,74.16 45.08,74.11 45.08,73.93 ; USB1.B6 44.08,73.94 44.32,74.18 44.83,74.18 45.08,73.93 ; 45.08,73.93 USB1.A6 ; 28.25,46.49 28.25,45.53 29.59,44.19 31,44.19 31.19,44 v1(31.75,44)
  Bottom Layer w0.254: v1(31.75,44) 32.31,44 32.5,44.19 37.13,44.19 38.99,46.05 38.99,47.25 39.17,47.43 39.19,47.43 39.37,47.61 39.37,48.77 39.19,48.95 39.17,48.95 38.99,49.13 38.99,50.3 39.17,50.48 39.19,50.48 39.37,50.66 39.37,51.82 39.19,52 39.17,52 38.99,52.18 38.99,74.2 40.48,75.68 40.84,75.68 42,76.85 44.95,76.85 45.13,76.67 45.13,76.42 44.94,76.23 v1(44.94,75.67)
PA13: length 41.3
  Top Layer w0.254: v1(18.29,55.74) 18.29,69.2 16.13,71.36 16.13,75.94 ; 27.75,46.49 27.75,45.39 27.32,44.97 20.55,44.97 v1(20.19,45.33)
  Bottom Layer w0.254: v1(20.19,45.33) 18.54,46.98 18.54,55.49 v1(18.29,55.74)
PA14: length 38.9
  Top Layer w0.254: v1(17.4,55.74) 17.4,69.33 13.59,73.14 H2.3 ; v1(18.67,45.71) 19.82,44.56 24.8,44.56
  Bottom Layer w0.254: v1(18.67,45.71) 18.03,46.34 18.03,55.11 v1(17.4,55.74)
PB10: length 55.4
  Top Layer w0.254: 36.2,43.06 48.41,43.06 57.78,52.44 HDR2.16
  Bottom Layer w0.254: R33.1 43.59,66.66 43.71,66.54 ; 43.71,66.54 v1(43.71,42.98) ; 43.71,66.54 P3.2
PB11: length 55.4
  Top Layer w0.254: 58.42,54.98 57.15,54.98 v1(46.24,44.07) 45.73,43.56 36.2,43.56
  Bottom Layer w0.254: 46.21,66.67 48.39,66.67 ; v1(46.24,44.07) 46.21,44.04 P3.3
PB12: length 101.5
  Top Layer w0.254: HDR2.18 57.78,56.89 56.64,56.89 52.83,53.08 v1(48.01,53.08) 34.29,53.08 34.25,53.04 34.25,46.49
  Bottom Layer w0.254: U8.2 21.02,12.37 19.56,13.83 19.56,15.74 20.45,16.63 38.1,16.63 41.78,20.31 46.35,20.31 48.01,21.96 v1(48.01,53.08)
PB13: length 98.2
  Top Layer w0.254: HDR1.2 1.78,59.81 5.14,59.81 v1(7.58,57.38) 10.86,54.09 29.97,54.09 33.75,50.31 33.75,46.49
  Bottom Layer w0.254: v1(7.58,57.38) 5.33,55.14 5.33,18.79 10.54,13.58 17.27,13.58 18.52,12.33 U8.3
PB14: length 95.2
  Top Layer w0.254: 33.25,46.49 33.25,50.18 29.97,53.46 10.67,53.46 6.6,57.52 v1(5.94,57.52) HDR1.3
  Bottom Layer w0.254: v1(5.94,57.52) 4.57,56.16 4.57,18.02 9.53,13.07 15.24,13.07 16.13,12.18 16.13,9.67 U8.4
PB15: length 88.7
  Top Layer w0.254: 32.75,46.49 32.75,50.04 29.84,52.95 9.27,52.95 7.24,54.98 v1(3.98,54.98) 1.52,54.98
  Bottom Layer w0.254: U8.5 13.52,11.74 12.83,12.44 8.64,12.44 3.98,17.09 v1(3.98,54.98)
PC6: length 85.9
  Top Layer w0.254: v1(14.48,14.47) 20.96,14.47 TFT1.8 ; 32.25,46.49 32.25,49.91 29.78,52.37 v1(8.16,52.37) 1.59,52.37 HDR1.5
  Bottom Layer w0.254: v1(14.48,14.47) 11.43,14.47 6.1,19.8 6.1,50.31 v1(8.16,52.37)
PC7: length 35.2
  Top Layer w0.254: 31.75,46.49 31.75,49.65 29.46,51.93 10.92,51.93 8.89,49.9 1.52,49.9
PC8: length 35.1
  Top Layer w0.254: 31.25,46.49 31.25,49.51 29.46,51.3 11.3,51.3 7.82,47.82 1.98,47.82 HDR1.7
PC9: length 35
  Top Layer w0.254: HDR1.8 5.97,44.82 11.76,50.61 29.51,50.61 30.75,49.38 30.75,46.49
PC10: length 59.9
  Top Layer w0.254: 25.46,43.52 25.41,43.47 15.66,43.47 4.48,32.29 1.69,32.29 1.52,32.12 ; 25.46,43.52 U4.51 ; 25.46,43.52 25.49,43.52 25.9,43.93 v1(27.81,43.93)
  Bottom Layer w0.254: 27.71,66.53 27.71,44.04 v1(27.81,43.93) ; 27.71,66.53 27.7,66.53 R35.1 ; 27.71,66.53 P4.2
PC11: length 64.1
  Top Layer w0.254: v1(27.81,42.92) 25.91,42.92 25.76,43.06 16.15,43.06 4.44,31.36 4.44,29.83 4.27,29.66 1.6,29.66 HDR1.14
  Bottom Layer w0.254: v1(27.81,42.92) 29.46,42.92 30.73,44.19 30.73,66.04 30.21,66.57 ; 30.21,66.57 31.71,66.57 R36.1 ; 30.21,66.57 P4.3
PC12: length 31.8
  Top Layer w0.254: HDR1.15 4.83,27.04 5.46,27.68 5.46,31.23 16.79,42.56 24.8,42.56
PC13: length 44.9
  Top Layer w0.254: v1(15.49,55.74) 15.49,62.09 14.22,63.36 R18.1 ; v1(27.05,37.58) 27.23,37.4 U4.2
  Bottom Layer w0.254: v1(27.05,37.58) 15.75,37.58 15.49,37.84 v1(15.49,55.74)
PD2: length 33.8
  Top Layer w0.254: 24.8,42.06 17.56,42.06 6.48,30.98 6.48,25.39 5.72,24.63 1.65,24.63 HDR1.16
RTS: length 7.4
  Top Layer w0.254: Q2.2 28.76,70.2 28.96,70.01 28.96,66.16 28.45,65.65 U9.14
USB_D+: length 27.5
  Top Layer w0.254: USB2.A6 29.46,73.91 29.21,74.16 28.65,74.16 28.47,73.98 28.47,73.32 USB2.B6 28.46,72.5 28.51,72.46 28.51,72.03 29.3,71.24 36.14,71.24 36.7,70.68 36.7,64.25 35.56,63.11 33.91,63.11 31.5,60.7 31.5,60.19 30.99,59.68 U9.5
USB_D-: length 27.5
  Top Layer w0.254: U9.6 32.26,59.81 31.9,60.16 31.9,60.53 34.08,62.7 36.11,62.7 37.59,64.19 37.59,70.54 36.49,71.64 29.47,71.64 28.91,72.2 28.91,72.46 28.96,72.5 28.96,72.63 ; 28.96,72.63 29.11,72.48 29.73,72.48 29.96,72.71 USB2.B7 ; 28.96,72.63 USB2.A7
$1N664: length 8.3
  Top Layer w0.508: v1(20.57,33.39) 20.51,33.46 19.2,33.46
  Bottom Layer w0.508: BT2.1 26,35.68 22.61,35.68 20.57,33.64 v1(20.57,33.39)
$1N720: length 6.5
  Top Layer w0.254: R11.1 26.79,75.56 27.46,74.89 USB2.B5
$1N724: length 6.8
  Top Layer w0.254: R12.1 35.3,75.56 30.99,75.56 30.46,75.03 USB2.A5
$1N745: length 1.7
  Top Layer w0.254: 8.1,63.51 8.01,63.41 LED5.2
$1N748: length 1.6
  Top Layer w0.254: R19.2 8.07,61.51 LED6.2
$1N755: length 6.2
  Top Layer w0.254: R13.2 43.95,27.81 42.8,26.66 42.8,23.99 42.16,23.36 H6.3
$1N756: length 2.4
  Top Layer w0.254: R14.1 41.53,28.3 H6.4
$1N759: length 1.7
  Top Layer w0.254: R17.2 8.09,65.44 LED4.2
$2N8: length 6.7
  Top Layer w0.254: R2.1 51.05,75.56 46.92,75.56 46.08,74.72 USB1.A5
$2N11: length 7.1
  Top Layer w0.254: R1.1 38.22,75.68 42.54,75.68 43.08,75.15 USB1.B5
$3N13: length 4.1
  Top Layer w0.254: R3.2 R4.1 12.56,70.22 11.74,70.22 11.56,70.4 Q1.1
$3N14: length 5.1
  Top Layer w0.254: D2.2 9.01,70.75 9.01,72.25 Q1.3 6.72,72.51 6.45,72.78
$3N51: length 5
  Top Layer w0.254: R7.2 30.86,66.79 30.61,67.05 30.61,68.95 31.86,70.2 Q2.1
$3N54: length 1.5
  Top Layer w0.254: R15.2 27.81,66.67 Q3.3
$3N55: length 5.8
  Top Layer w0.254: D1.1 34.54,68.06 34.04,67.56 33.83,67.56 33.82,67.55 R16.1 32.89,67.61 32.89,67.9 32.59,68.2 Q2.3

## Copper pours and planes (outline as drawn; the poured copper is in the pictures)
+3V3 on Top Layer: 37.85,61.69 56.39,61.69 56.39,57.27 37.85,57.27
+5V on Top Layer: 39.37,69.6 54.47,69.6 54.47,60.95 39.37,60.95
GND on Top Layer: -7.62,86.98 78.49,86.98 78.49,-8.9 -7.62,-8.9
GND on Bottom Layer: -4.06,85.59 67.94,85.59 67.94,-6.23 -4.06,-6.23

Small or netless copper shapes (teardrops, artwork), in the pictures only: 401 on Top Layer, 117 on Bottom Layer

## Text on the board
Bottom Silkscreen Layer: SPI2 | 串口
Top Silkscreen Layer: 3V3 | PB13 | PB14 | PB15 | PC6 | PC7 | PC8 | PC9 | PA8 | PA9 | PA10 | PA15 | PC10 | PC11 | PC12 | PD2 | PB3 | PB4 | PB5 | PB6 | GND | CLK | DIO | IC1 | SPI1 | USB | PB12 | PB11 | PB10 | PB1 | PB0 | PA7 | PA6 | PA5 | PA4 | PA3 | PA2 | PA1 | PA0 | PC3 | PC2 | PC1 | PC0 | NRST | KEY1 | 串口 | KEY2
